# EAGLE design source_eagle (EAGLE 6.4)
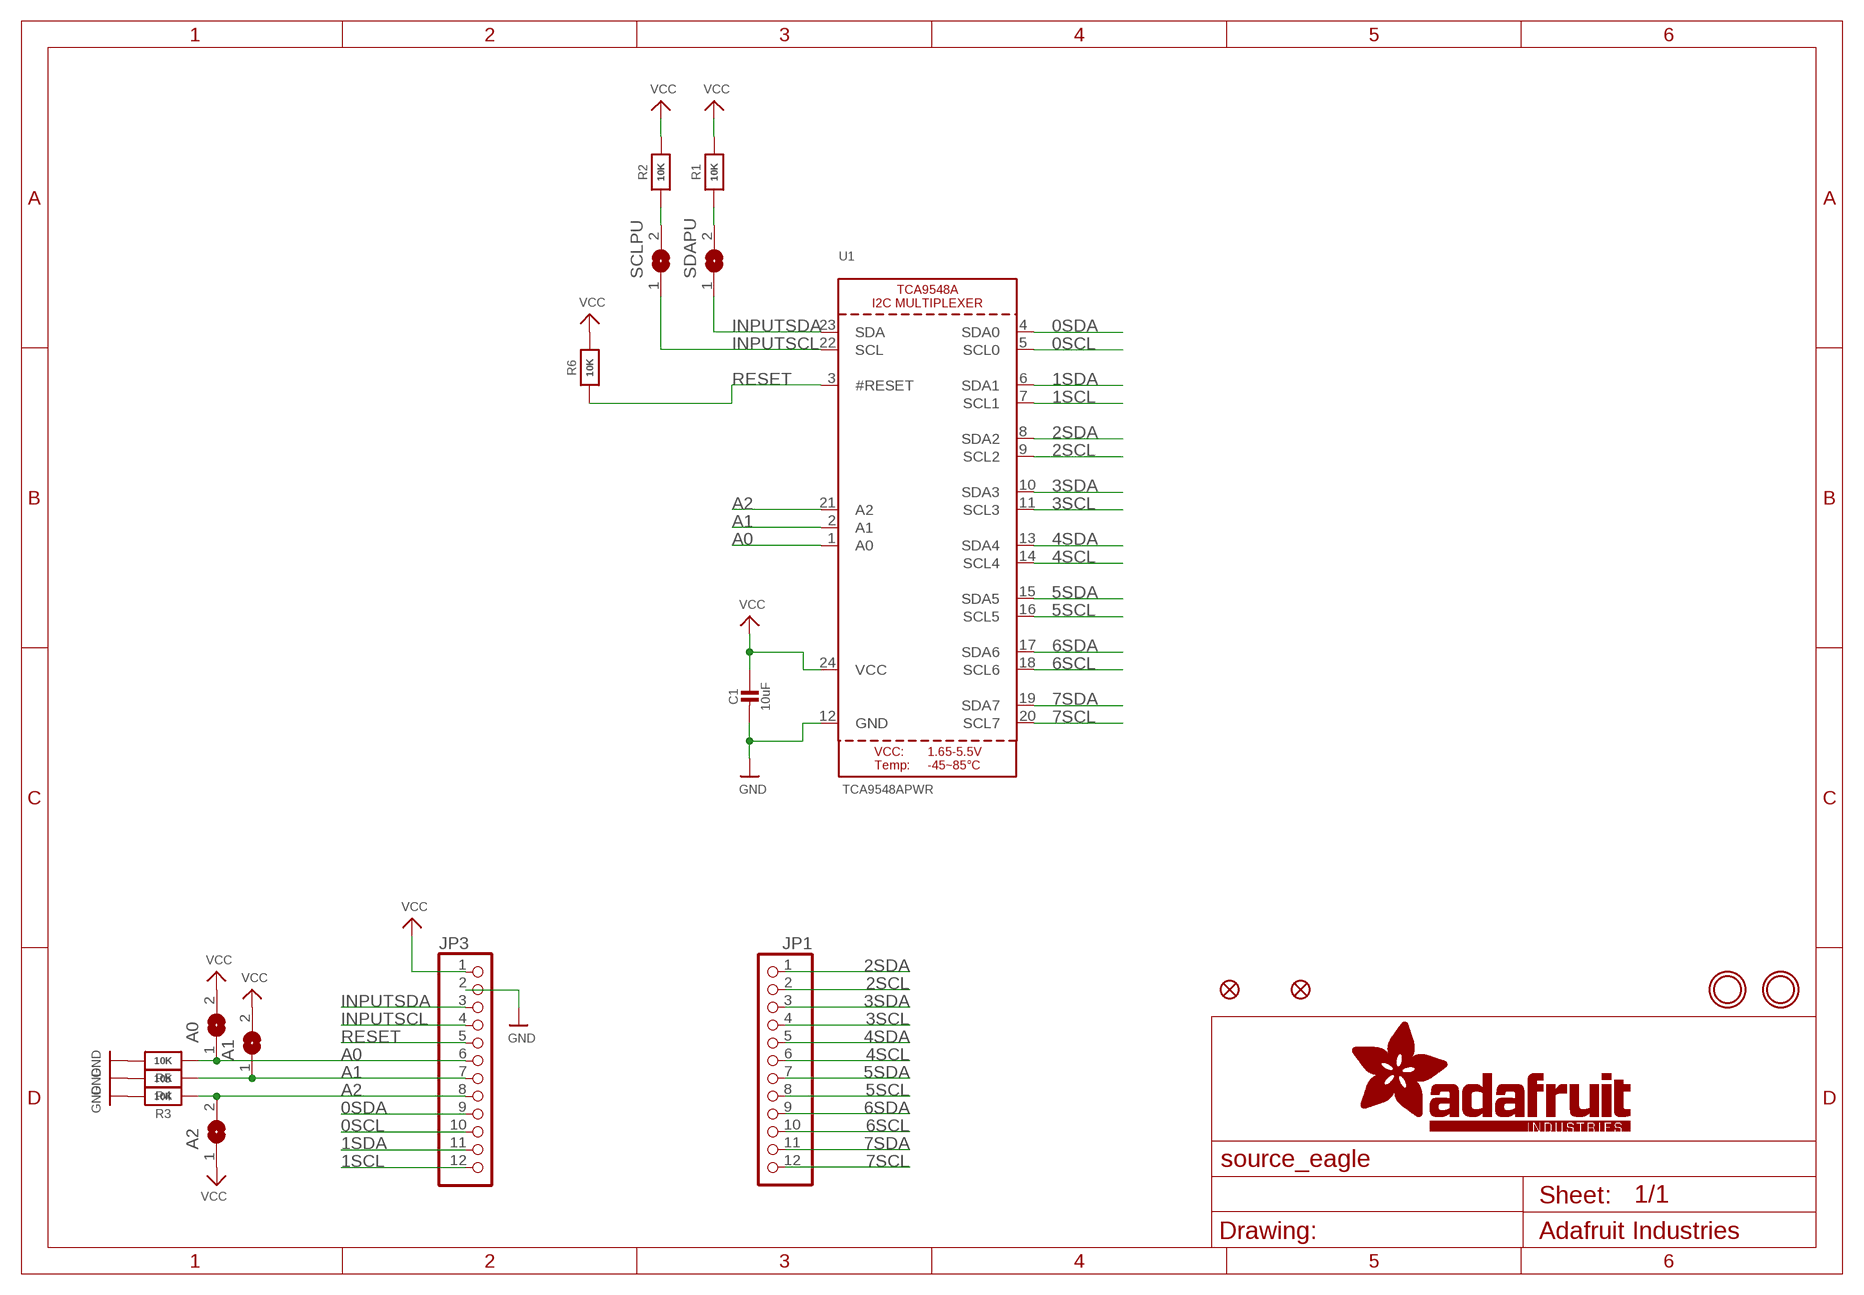
[diagram p0: schematic, sheet 1]

## Parts
A0  SOLDERJUMPER  [SOLDERJUMPER_ARROW_NOPASTE]
A1  SOLDERJUMPER  [SOLDERJUMPER_ARROW_NOPASTE]
A2  SOLDERJUMPER  [SOLDERJUMPER_ARROW_NOPASTE]
C1  10uF  CAP_CERAMIC0805-NOOUTLINE  [0805-NO]
FID1  FIDUCIAL""  [FIDUCIAL_1MM]
FID3  FIDUCIAL""  [FIDUCIAL_1MM]
JP1  HEADER-1X12  [1X12_ROUND]
JP3  HEADER-1X12  [1X12_ROUND]
R1  10K  RESISTOR0805_NOOUTLINE  [0805-NO]
R2  10K  RESISTOR0805_NOOUTLINE  [0805-NO]
R3  10K  RESISTOR0805_NOOUTLINE  [0805-NO]
R4  10K  RESISTOR0805_NOOUTLINE  [0805-NO]
R5  10K  RESISTOR0805_NOOUTLINE  [0805-NO]
R6  10K  RESISTOR_0805MP  [_0805MP]
SCLPU  SOLDERJUMPERCLOSED  [SOLDERJUMPER_CLOSEDWIRE]
SDAPU  SOLDERJUMPERCLOSED  [SOLDERJUMPER_CLOSEDWIRE]
U1  TCA9548APWR  TCA9548A  [TSSOP24]
U$4  MOUNTINGHOLE2.5  [MOUNTINGHOLE_2.5_PLATED]
U$5  MOUNTINGHOLE2.5  [MOUNTINGHOLE_2.5_PLATED]

## Nets
0SCL: JP3.10 U1.5(SCL0)
0SDA: JP3.9 U1.4(SDA0)
1SCL: JP3.12 U1.7(SCL1)
1SDA: JP3.11 U1.6(SDA1)
2SCL: JP1.2 U1.9(SCL2)
2SDA: JP1.1 U1.8(SDA2)
3SCL: JP1.4 U1.11(SCL3)
3SDA: JP1.3 U1.10(SDA3)
4SCL: JP1.6 U1.14(SCL4)
4SDA: JP1.5 U1.13(SDA4)
5SCL: JP1.8 U1.16(SCL5)
5SDA: JP1.7 U1.15(SDA5)
6SCL: JP1.10 U1.18(SCL6)
6SDA: JP1.9 U1.17(SDA6)
7SCL: JP1.12 U1.20(SCL7)
7SDA: JP1.11 U1.19(SDA7)
A0: A0.1 JP3.6 R5.1 U1.1(A0)
A1: A1.1 JP3.7 R4.1 U1.2(A1)
A2: A2.2 JP3.8 R3.1 U1.21(A2)
GND: C1.2 JP3.2 R3.2 R4.2 R5.2 U1.12(GND)
INPUTSCL: JP3.4 SCLPU.1 U1.22(SCL)
INPUTSDA: JP3.3 SDAPU.1 U1.23(SDA)
N$3: R2.1 SCLPU.2
N$4: R1.1 SDAPU.2
RESET: JP3.5 R6.1 U1.3(#RESET)
VCC: A0.2 A1.2 A2.1 C1.1 JP3.1 R1.2 R2.2 R6.2 U1.24(VCC)

## Library data of the parts
A0 A1 A2 = microbuilder:SOLDERJUMPER: SMD Solder JUMPER Solder the two pads together to create a connection, or remove the solder to break it. REFLOW - Use this footprint for solder paste and reflow ovens. WAVE - Use this footprint for hand-soldering (larger pads). CLOSED - Has a trace between the two pads to ensure it is closed by default. The trace needs to be cut to disable the jumper, and can be closed again by creating a solder bridge between the two pads.; BOM: EXCLUDE
C1 = microbuilder:CAP_CERAMIC: Ceramic Capacitors For new designs, use the packages preceded by an '_' character since they are more reliable: The following footprints should be used on most boards: _0402 - Standard footprint for regular board layouts _0603 - Standard footprint for regular board layouts _0805 - Standard footprint for regular board layouts _1206 - Standard footprint for regular board layouts For extremely tight-pitch boards where space is at a premium, the following 'micro-pitch' footprints can be used (smaller pads, no silkscreen outline, etc.): _0402MP - Micro-pitch footprint for very dense/compact boards _0603MP - Micro-pitch footprint for very dense/compact boards _0805MP - Micro-pitch footprint for very dense/compact boards _1206MP - Micro-pitch footprint for very dense/compact boards
FID1 FID3 = microbuilder:FIDUCIAL: Fiducial Alignment Points Various fiducial points for machine vision alignment.; BOM: EXCLUDE
JP1 JP3 = microbuilder:HEADER-1X12
R1-R6 = microbuilder:RESISTOR: Resistors For new designs, use the packages preceded by an '_' character since they are more reliable: The following footprints should be used on most boards: _0402 - Standard footprint for regular board layouts _0603 - Standard footprint for regular board layouts _0805 - Standard footprint for regular board layouts _1206 - Standard footprint for regular board layouts For extremely tight-pitch boards where space is at a premium, the following 'micro-pitch' footprints can be used (smaller pads, no silkscreen outline, etc.): _0402MP - Micro-pitch footprint for very dense/compact boards _0603MP - Micro-pitch footprint for very dense/compact boards _0805MP - Micro-pitch footprint for very dense/compact boards _1206MP - Micro-pitch footprint for very dense/compact boards
SCLPU SDAPU = microbuilder:SOLDERJUMPER: SMD Solder JUMPER Solder the two pads together to create a connection, or remove the solder to break it. REFLOW - Use this footprint for solder paste and reflow ovens. WAVE - Use this footprint for hand-soldering (larger pads). CLOSED - Has a trace between the two pads to ensure it is closed by default. The trace needs to be cut to disable the jumper, and can be closed again by creating a solder bridge between the two pads.
U1 = microbuilder:TCA9548A: TCA9548A I2C Multiplexer
U$4 U$5 = microbuilder:MOUNTINGHOLE: Mounting Hole For #2 screws (0.086"/2.18mm width, 0.094"/2.4mm hole) use 2.5mm; BOM: EXCLUDE

## Board
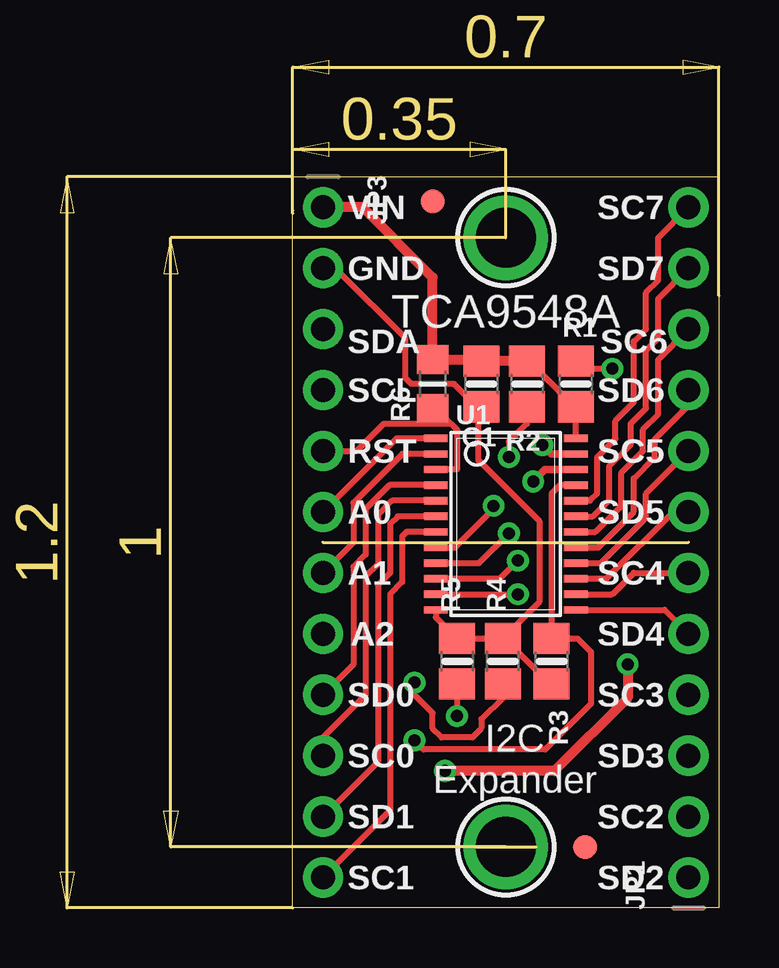
[diagram p1: board, top side]
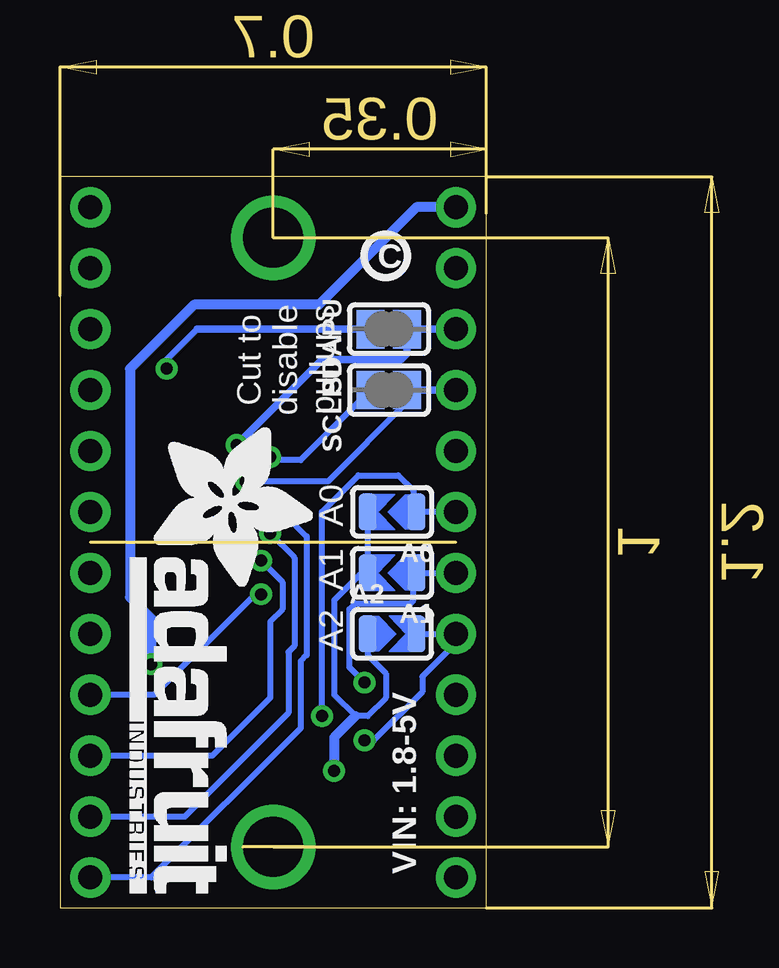
[diagram p2: board, bottom side, seen from below]

Size 27.48 x 35.35 mm. Coordinates in mm from the lower left corner, seen from the top.
Outline: 27.48,0 9.7,0 9.7,30.48 27.48,30.48 27.48,0
Copper layers (1*16): Top 0.035mm / dielectric 1.5mm / Bottom 0.035mm
Design rules "adafruit *": minimum track width 8mil, minimum drill 15.5mil, track to track 10mil, track to pad 10mil, pad to pad 10mil, via to via 10mil, smd to smd 8mil, copper to edge 10mil, drill to drill 8mil, minimum pad ring 10mil, minimum via ring 8mil, stop-mask expansion 2mil, vias tented up to drill 20mil, thermal gap 10mil

### Footprints (pad centres in the part's own frame; a part is rotated, then mirrored left to right if it is on the bottom)
SOLDERJUMPER_ARROW_NOPASTE = smd 0.762 x 1.524: 1 -1.016,0; 2 1.016,0
0805-NO = smd 1.3 x 1.5: 1 -0.95,0; 2 0.95,0
FIDUCIAL_1MM = smd 1 x 1: 1 0,0
1X12_ROUND = drill 1 pad 1.676: 1 -13.97,0; 2 -11.43,0; 3 -8.89,0; 4 -6.35,0; 5 -3.81,0; 6 -1.27,0; 7 1.27,0; 8 3.81,0; 9 6.35,0; 10 8.89,0; 11 11.43,0; 12 13.97,0
_0805MP = smd 1.2 x 1.3: 1 -1.016,0; 2 1.016,0
SOLDERJUMPER_CLOSEDWIRE = smd 1.168 x 1.6: 1 -0.762,0; 2 0.762,0 | smd 0.635 x 0.203: WIRE 0,0
TSSOP24 = smd 0.305 x 0.991: 1 -3.575,-2.918; 2 -2.925,-2.918; 3 -2.275,-2.918; 4 -1.625,-2.918; 5 -0.975,-2.918; 6 -0.325,-2.918; 7 0.325,-2.918; 8 0.975,-2.918; 9 1.625,-2.918; 10 2.275,-2.918; 11 2.925,-2.918; 12 3.575,-2.918; 13 3.575,2.918; 14 2.925,2.918; 15 2.275,2.918; 16 1.625,2.918; 17 0.975,2.918; 18 0.325,2.918; 19 -0.325,2.918; 20 -0.975,2.918; 21 -1.625,2.918; 22 -2.275,2.918; 23 -2.925,2.918; 24 -3.575,2.918
MOUNTINGHOLE_2.5_PLATED = drill 2.5 pad 3.2: P$1 0,0

### Placement (x,y rotation side)
A0  13.63,16.51 180 bottom
A1  13.63,13.97 180 bottom
A2  13.63,11.43 0 bottom
C1  17.57,21.84 270 top
FID1  15.54,29.46 0 top
FID3  21.89,2.54 0 top
JP1  26.21,15.24 90 top
JP3  10.97,15.24 270 top
R1  21.51,21.84 270 top
R2  19.48,21.84 90 top
R3  20.49,10.29 270 top
R4  18.46,10.29 90 top
R5  16.56,10.29 90 top
R6  15.54,21.84 90 top
SCLPU  13.76,21.59 180 bottom
SDAPU  13.76,24.13 180 bottom
U1  18.59,16 270 top
U$4  18.59,2.54 0 top
U$5  18.59,27.94 0 top
U$6  [PCBFEAT-REV-040]  13.89,27.18 0 bottom
U$7  [ADAFRUIT_TEXT_20MM]  24.56,20.19 270 bottom

### Tracks (layer width: path | path; a pad name or v marks a point on that pad's centre or on a via)
0SCL
  Top 0.254: U1.5 13.85,16.98 13.25,16.38 13.25,14.35 12.75,13.84 12.75,8.89 10.97,7.11 JP3.10
0SDA
  Top 0.254: U1.4 13.74,17.63 12.75,16.64 12.75,14.73 12.24,14.22 12.24,10.16 JP3.9
1SCL
  Top 0.254: U1.7 14.45,15.68 14.27,15.49 14.27,13.59 13.76,13.08 13.76,4.06 JP3.12
1SDA
  Top 0.254: U1.6 14.09,16.33 13.76,16 13.76,13.97 13.25,13.46 13.25,6.1 JP3.11
2SCL  (via drill 0.5)
  Top 0.254: U1.9 17.47,14.38 v18.71,15.62
  Bottom 0.254: v18.71,15.62 17.7,14.61 17.7,10.92 17.95,10.67 17.95,8.13 22.27,3.81 JP1.2
2SDA  (via drill 0.5)
  Top 0.254: U1.8 16.47,15.03 18.08,16.64 v18.08,16.76
  Bottom 0.254: v18.08,16.76 18.08,16.38 17.19,15.49 17.19,10.54 17.45,10.29 17.45,7.49 23.67,1.27 JP1.1
3SCL  (via drill 0.5)
  Top 0.254: U1.11 v19.09,13.08 v19.1,13.08
  Bottom 0.254: v19.1,13.08 19.35,13.08 23.54,8.89 JP1.4
3SDA  (via drill 0.5)
  Top 0.254: U1.10 18.34,13.73 v19.1,14.48
  Bottom 0.254: v19.1,14.48 18.21,13.59 18.21,12.45 18.71,11.94 18.71,8.76 21.13,6.35 JP1.3
4SCL
  Top 0.254: U1.14 23.03,13.08 23.92,13.97 JP1.6
4SDA
  Top 0.254: U1.13 25.21,12.43 JP1.5
5SCL
  Top 0.254: U1.16 22.55,14.38 24.43,16.26 24.43,17.27 JP1.8
5SDA
  Top 0.254: U1.15 22.79,13.73 25.57,16.51 JP1.7
6SCL
  Top 0.254: U1.18 22.33,15.68 23.41,16.76 23.41,18.16 24.3,19.05 24.3,19.94 24.94,20.57 24.94,22.86 JP1.10
6SDA
  Top 0.254: U1.17 22.44,15.03 23.92,16.51 23.92,17.91 24.81,18.8 24.81,19.56 26.21,20.95 JP1.9
7SCL
  Top 0.254: U1.20 22.1,16.98 22.4,17.27 22.4,18.8 23.16,19.56 23.16,20.32 23.92,21.08 23.92,23.62 24.43,24.13 24.43,25.65 24.94,26.16 24.94,27.94 JP1.12
7SDA
  Top 0.254: U1.19 22.21,16.33 22.91,17.02 22.91,18.41 23.8,19.3 23.8,20.19 24.43,20.83 24.43,23.24 24.94,23.75 24.94,25.4 JP1.11
A0  (via drill 0.5)
  Top 0.254: U1.1 14.04,19.58 JP3.6 | R5.1 v16.56,8
  Bottom 0.254: JP3.6 A0.1 12.75,16.64 12.75,17.4 13.38,18.03 15.03,18.03 16.56,16.51 v16.56,8
A1  (via drill 0.5)
  Top 0.254: U1.2 14.27,18.93 12.24,16.89 12.24,15.24 JP3.7 | R4.1 18.46,8.76 17.57,7.87 17.57,7.49 17.19,7.11 15.92,7.11 15.54,7.49 15.54,8.13 14.78,8.89 v14.78,9.4
  Bottom 0.254: JP3.7 A1.1 12.75,13.84 12.75,12.83 12.87,12.7 15.16,12.7 15.41,12.45 15.41,10.03 v14.78,9.4
A2  (via drill 0.5)
  Top 0.254: U1.21 20.85,17.63 20.49,17.27 R3.1 21.58,11.24 22.14,10.67 22.14,8.51 20.24,6.6 15.16,6.6 v14.78,6.99
  Bottom 0.254: A2.2 JP3.8 10.97,11.05 12.37,9.65 12.37,9.02 14.4,6.99 v14.78,6.99
GND
  Top 0.254: U1.12 15.67,12.12 R5.2 R4.2 | R4.2 18.53,11.24 20.43,9.34 R3.2 | R4.2 19.98,12.76 19.98,16.13 17.45,18.67 17.45,20.83 | 17.45,20.83 16.43,21.84 14.65,21.84 14.4,22.1 14.4,23.75 11.6,26.54 11.1,26.54 JP3.2 | 17.45,20.83 17.51,20.83 C1.2
INPUTSCL  (via drill 0.5)
  Top 0.305: U1.22 20.23,18.28 v19.73,17.78
  Bottom 0.254: SCLPU.1 13,21.08 16.3,17.78 v19.73,17.78
  Bottom 0.305: SCLPU.1 JP3.4
INPUTSDA  (via drill 0.5)
  Top 0.305: U1.23 20.49,18.93 v20.11,19.3
  Bottom 0.305: JP3.3 SDAPU.1 13,23.11 13.25,22.86 16.56,22.86 v20.11,19.3
N$3  (via drill 0.5)
  Top 0.254: R2.1 19.48,20.19 18.71,19.43 v18.71,18.8
  Bottom 0.254: v18.71,18.8 18.59,18.67 17.45,18.67 SCLPU.2
N$4  (via drill 0.5)
  Top 0.254: R1.1 21.82,22.48 v23.03,22.48
  Bottom 0.254: 21.76,24.13 23.03,22.86 v23.03,22.48
  Bottom 0.305: SDAPU.2 21.76,24.13
RESET
  Top 0.254: JP3.5 12.37,19.05 13.51,20.19 16.3,20.19 | 16.3,20.19 16.56,19.94 16.56,18.29 15.68,18.29 U1.3 | 16.3,20.19 15.73,20.77 15.6,20.77 R6.1
VCC  (via drill 0.5)
  Top 0.254: 17.51,22.86 C1.1 | R2.2 19.54,22.79 21.44,20.89 R1.2 | R1.2 | U1.24 R1.2
  Top 0.305: U1.24 21.36,19.58
  Top 0.406: JP3.1 12.62,29.21 15.54,26.29 R6.2 17.51,22.86 | v23.67,10.16 23.67,8.76 20.62,5.71 v16.05,5.71 | R2.2 C1.1
  Bottom 0.254: A0.2 A1.2 14.91,13.97 16.05,12.83 16.05,8.89 15.16,8 14.65,8 13.89,8.76 13.89,9.78 14.65,10.54 A2.1 | v16.05,5.71 16.05,5.59
  Bottom 0.406: v16.05,5.71 16.05,7.11 15.16,8 | JP3.1 12.62,29.21 16.68,25.15 21.89,25.15 24.56,22.48 24.56,12.95 23.67,12.06 v23.67,10.16

### Text on the board
tPlace: VIN | SC7 | GND | SD7 | TCA9548A | SDA | SC6 | SCL | SD6 | RST | SC5 | A0 | SD5 | A1 | SC4 | A2 | SD4 | SD0 | SC3 | SC0 | I2C / Expander | SD3 | SD1 | SC2 | SC1 | SD2
bPlace: Cut to / disable / pullups | A0 | A1 | A2 | VIN: 1.8-5V